# Altium schematic sheet Fuentes.SchDoc
size A4; SheetNumber: 2; SheetTotal: 2
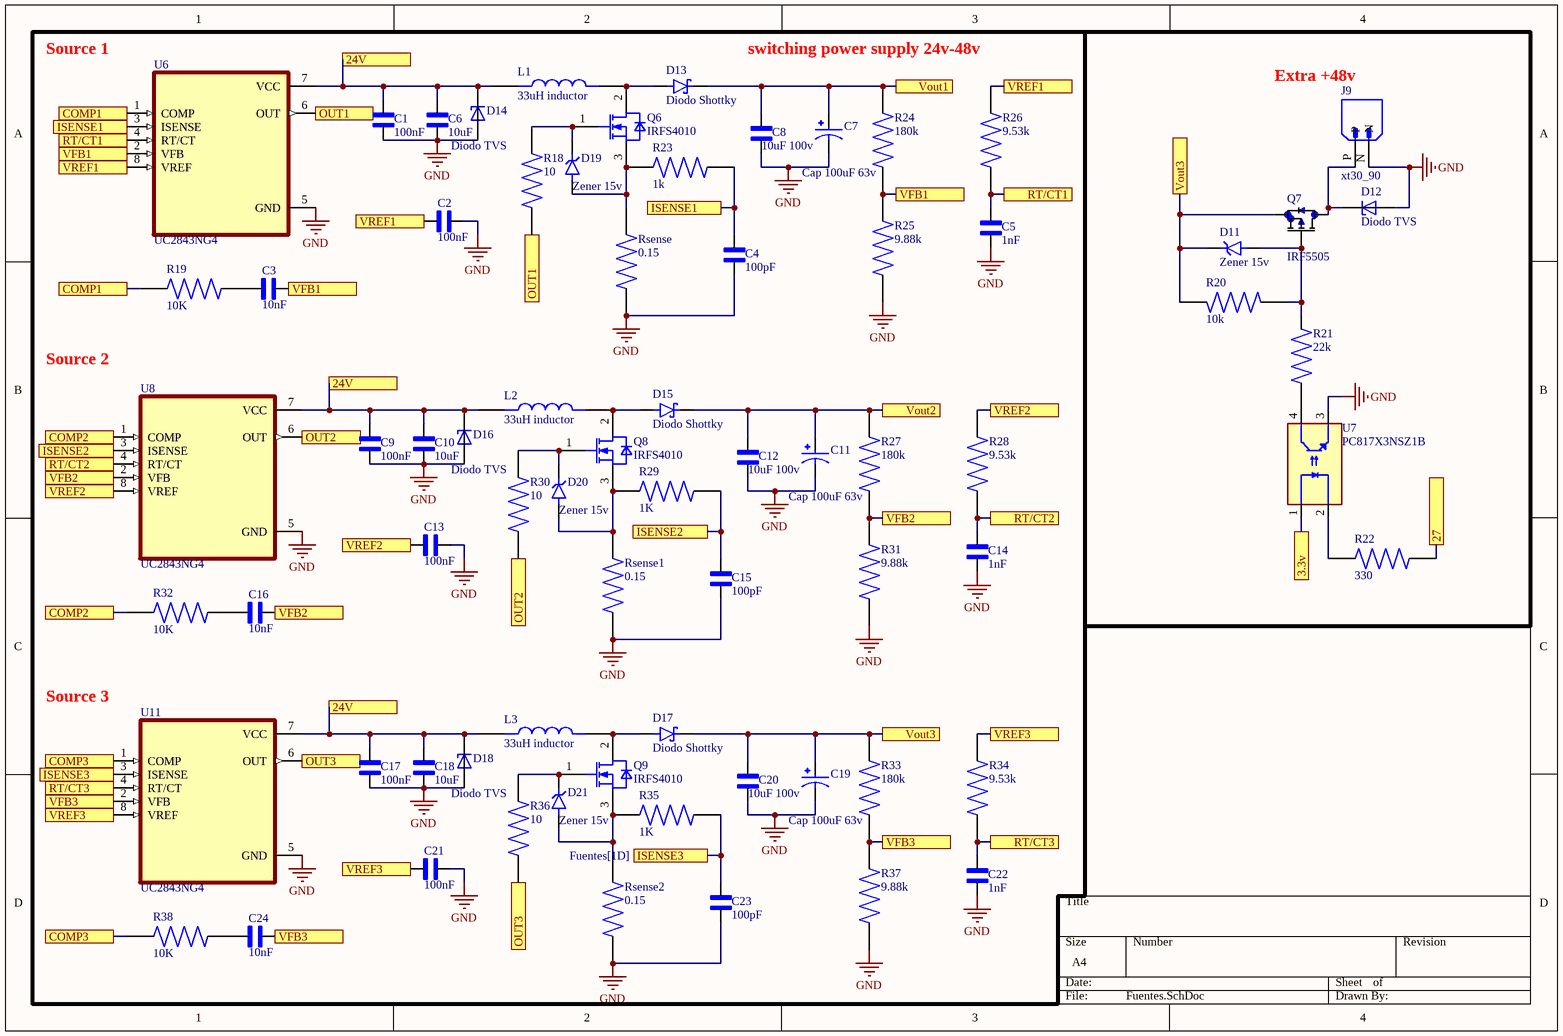
[diagram p0: Fuentes.SchDoc]

## Parts
C1  100nF  [Cap SMD 1206]
C2  100nF  [Cap SMD 1206]
C3  10nF  [Cap SMD 1206]
C4  100pF  [Cap SMD 1206]
C5  1nF  [Cap SMD 1206]
C6  10uF  [Cap SMD 1206]
C7  Cap 100uF 63v  [Cap 100uH 63v]
C8  10uF 100v  [Cap SMD 1210]
C9  100nF  [Cap SMD 1206]
C10  10uF  [Cap SMD 1206]
C11  Cap 100uF 63v  [Cap 100uH 63v]
C12  10uF 100v  [Cap SMD 1210]
C13  100nF  [Cap SMD 1206]
C14  1nF  [Cap SMD 1206]
C15  100pF  [Cap SMD 1206]
C16  10nF  [Cap SMD 1206]
C17  100nF  [Cap SMD 1206]
C18  10uF  [Cap SMD 1206]
C19  Cap 100uF 63v  [Cap 100uH 63v]
C20  10uF 100v  [Cap SMD 1210]
C21  100nF  [Cap SMD 1206]
C22  1nF  [Cap SMD 1206]
C23  100pF  [Cap SMD 1206]
C24  10nF  [Cap SMD 1206]
D11  Zener 15v  [Zener 15v 500mW SMD]
D12  Diodo TVS  [Diodo TVS]
D13  Diodo Shottky  [Diodo Sottky SS510FSH]
D14  Diodo TVS  [Diodo SMAJ28A TVS]
D15  Diodo Shottky  [Diodo Sottky SS510FSH]
D16  Diodo TVS  [Diodo SMAJ28A TVS]
D17  Diodo Shottky  [Diodo Sottky SS510FSH]
D18  Diodo TVS  [Diodo SMAJ28A TVS]
D19  Zener 15v  [Zener 15v 500mW SMD]
D20  Zener 15v  [Zener 15v 500mW SMD]
D21  Zener 15v  [Zener 15v 500mW SMD]
J9  xt30_90  [XT30_90]
L1  33uH inductor  [33uH Inductor]
L2  33uH inductor  [33uH Inductor]
L3  33uH inductor  [33uH Inductor]
Q6  IRFS4010  [IRFS4010]
Q7  IRF5505  [irf5505]
Q8  IRFS4010  [IRFS4010]
Q9  IRFS4010  [IRFS4010]
R18  10  [Resistencia 1306]
R19  10K  [Resistencia 1306]
R20  10k  [Resistencia 1306]
R21  22k  [Resistencia 1306]
R22  330  [Resistencia 1306]
R23  1k  [Resistencia 1306]
R24  180k  [Resistencia 1306]
R25  9.88k  [Resistencia 1306]
R26  9.53k  [Resistencia 1306]
R27  180k  [Resistencia 1306]
R28  9.53k  [Resistencia 1306]
R29  1K  [Resistencia 1306]
R30  10  [Resistencia 1306]
R31  9.88k  [Resistencia 1306]
R32  10K  [Resistencia 1306]
R33  180k  [Resistencia 1306]
R34  9.53k  [Resistencia 1306]
R35  1K  [Resistencia 1306]
R36  10  [Resistencia 1306]
R37  9.88k  [Resistencia 1306]
R38  10K  [Resistencia 1306]
Rsense  0.15  [R SMD 2512]
Rsense1  0.15  [R SMD 2512]
Rsense2  0.15  [R SMD 2512]
U6  UC2843NG4  [UC3843]
U7  PC817X3NSZ1B  [PC817X3NSZ1B]
U8  UC2843NG4  [UC3843]
U11  UC2843NG4  [UC3843]

## Ports
3.3v (see Control[1A], Control[1C], Control[2A], Control[2C], Control[3A], Control[3C]), 24V (see Control[3A], Control[3B], Control[4B], Control[4D], Fuentes[1A], Fuentes[1B]), 24V (see Control[3A], Control[3B], Control[4B], Control[4D], Fuentes[1A], Fuentes[1C]), 24V (see Control[3A], Control[3B], Control[4B], Control[4D], Fuentes[1B], Fuentes[1C]), 27 (see Control[1B], Control[1C], Control[2B], Control[2C], Control[3B], Control[3C]), COMP1 (see Fuentes[1A]), COMP1 (see Fuentes[1B]), COMP2 (see Fuentes[1B]), COMP2 (see Fuentes[1C]), COMP3 (see Fuentes[1C]), COMP3 (see Fuentes[1D]), ISENSE1 (see Fuentes[1A]), ISENSE1 (see Fuentes[2A]), ISENSE2 (see Fuentes[1B]), ISENSE2 (see Fuentes[2C]), ISENSE3 (see Fuentes[1D]), ISENSE3 (see Fuentes[2D]), OUT1 (see Fuentes[1A]), OUT1 (see Fuentes[2B]), OUT2 (see Fuentes[1B]), OUT2 (see Fuentes[2C]), OUT3 (see Fuentes[1C]), OUT3 (see Fuentes[2D]), RT/CT1 (see Fuentes[1A]), RT/CT1 (see Fuentes[3A]), RT/CT2 (see Fuentes[1B]), RT/CT2 (see Fuentes[3C]), RT/CT3 (see Fuentes[1D]), RT/CT3 (see Fuentes[3D]), VFB1 (see Fuentes[1A], Fuentes[1B]), VFB1 (see Fuentes[1A], Fuentes[3A]), VFB1 (see Fuentes[1B], Fuentes[3A]), VFB2 (see Fuentes[1B], Fuentes[1C]), VFB2 (see Fuentes[1B], Fuentes[3C]), VFB2 (see Fuentes[1C], Fuentes[3C]), VFB3 (see Fuentes[1D]), VFB3 (see Fuentes[1D], Fuentes[3D]), Vout1 (see Control[4A]), Vout2 (see Control[2B]), Vout3 (see Fuentes[3C]), Vout3 (see Fuentes[4A]), VREF1 (see Fuentes[1A]), VREF1 (see Fuentes[1A], Fuentes[3A]), VREF2 (see Fuentes[1B], Fuentes[1C]), VREF2 (see Fuentes[1B], Fuentes[3B]), VREF2 (see Fuentes[1C], Fuentes[3B]), VREF3 (see Fuentes[1D]), VREF3 (see Fuentes[1D], Fuentes[3C])

## Nets
GND: C1.2 C2.2 C4.2 C5.2 C6.1 C7.2 C8.1 C9.2 C10.1 C11.2 C12.1 C13.2 C14.2 C15.2 C17.2 C18.1 C19.2 C20.1 C21.2 C22.2 C23.2 D12.A D14.A D16.A D18.A J9.N R25.1 R31.1 R37.1 Rsense.1 Rsense1.1 Rsense2.1 U6.5(GND) U7.3(EMITTER) U8.5(GND) U11.5(GND)
3.3v: U7.1(ANODE) ; port 3.3v
24V: C1.1 C6.2 C9.1 C10.2 C17.1 C18.2 D14.C D16.C D18.C L1.1 L2.1 L3.1 U6.7(VCC) U8.7(VCC) U11.7(VCC) ; port 24V
27: R22.2 ; port 27
COMP1: R19.2 U6.1(COMP) ; port COMP1
COMP2: R32.2 U8.1(COMP) ; port COMP2
COMP3: R38.2 U11.1(COMP) ; port COMP3
ISENSE1: C4.1 R23.1 U6.3(ISENSE) ; port ISENSE1
ISENSE2: C15.1 R29.2 U8.3(ISENSE) ; port ISENSE2
ISENSE3: C23.1 R35.2 U11.3(ISENSE) ; port ISENSE3
OUT1: R18.1 U6.6(OUT) ; port OUT1
OUT2: R30.1 U8.6(OUT) ; port OUT2
OUT3: R36.1 U11.6(OUT) ; port OUT3
RT/CT1: C5.1 R26.2 U6.4(RT/CT) ; port RT/CT1
RT/CT2: C14.1 R28.2 U8.4(RT/CT) ; port RT/CT2
RT/CT3: C22.1 R34.2 U11.4(RT/CT) ; port RT/CT3
VFB1: C3.1 R24.1 R25.2 U6.2(VFB) ; port VFB1
VFB2: C16.1 R27.1 R31.2 U8.2(VFB) ; port VFB2
VFB3: C24.1 R33.1 R37.2 U11.2(VFB) ; port VFB3
Vout1: C7.1 C8.2 D13.C(K) R24.2 ; port Vout1
Vout2: C11.1 C12.2 D15.C(K) R27.2 ; port Vout2
Vout3: C19.1 C20.2 D11.1(K) D17.C(K) Q7.3(S) R20.1 R33.2 ; port Vout3
VREF1: C2.1 R26.1 U6.8(VREF) ; port VREF1
VREF2: C13.1 R28.1 U8.8(VREF) ; port VREF2
VREF3: C21.1 R34.1 U11.8(VREF) ; port VREF3
NetC3_2: C3.2 R19.1
NetC16_2: C16.2 R32.1
NetC24_2: C24.2 R38.1
NetD11_2: D11.2(A) Q7.1(G) R20.2 R21.2
NetD12_C: D12.C J9.P Q7.2(D)
NetD13_A: D13.A L1.2 Q6.2(DRAIN)
NetD15_A: D15.A L2.2 Q8.2(DRAIN)
NetD17_A: D17.A L3.2 Q9.2(DRAIN)
NetD19_1: D19.1(K) Q6.1(GATE) R18.2
NetD19_2: D19.2(A) Q6.3(SOURCE) R23.2 Rsense.2
NetD20_1: D20.1(K) Q8.1(GATE) R30.2
NetD20_2: D20.2(A) Q8.3(SOURCE) R29.1 Rsense1.2
NetD21_1: D21.1(K) Q9.1(GATE) R36.2
NetD21_2: D21.2(A) Q9.3(SOURCE) R35.1 Rsense2.2
NetR21_1: R21.1 U7.4(COLLECTOR)
NetR22_1: R22.1 U7.2(CATHODE)

## Notes on the sheet
- (near U6) Source 1
- switching power supply 24v-48v
- Extra +48v
- (near U8) Source 2
- (near U11) Source 3

## Library data of the parts
C1-C6 C9 C10 C13-C18 C21-C24 = Cap SMD 1206
C7 C11 C19 = Cap 100uH 63v
C8 C12 C20 = Cap SMD 1210
D11 D19-D21 = Zener 15v 500mW SMD
D12 = Diodo TVS SMAJ51
D14 D16 D18 = Diodo SMAJ28A TVS
R18-R38 = Resistencia 1306 SMD
Rsense Rsense1 Rsense2 = R SMD 2512